# EasyEDA Pro project ESP32S3_DMX_RDM_2026-06-09.epro, schematic Schematic_BAT

## Sheets
1 P1: Create Date: 2026-08-19; Page Name: P1; Project Name: ESP32S3_DMX_RDM_2026-06-09; Schematic Name: Schematic1; Update Date: 2026-08-19; Company: 嘉立创EDA; Page Size: A3; Version: V1.0
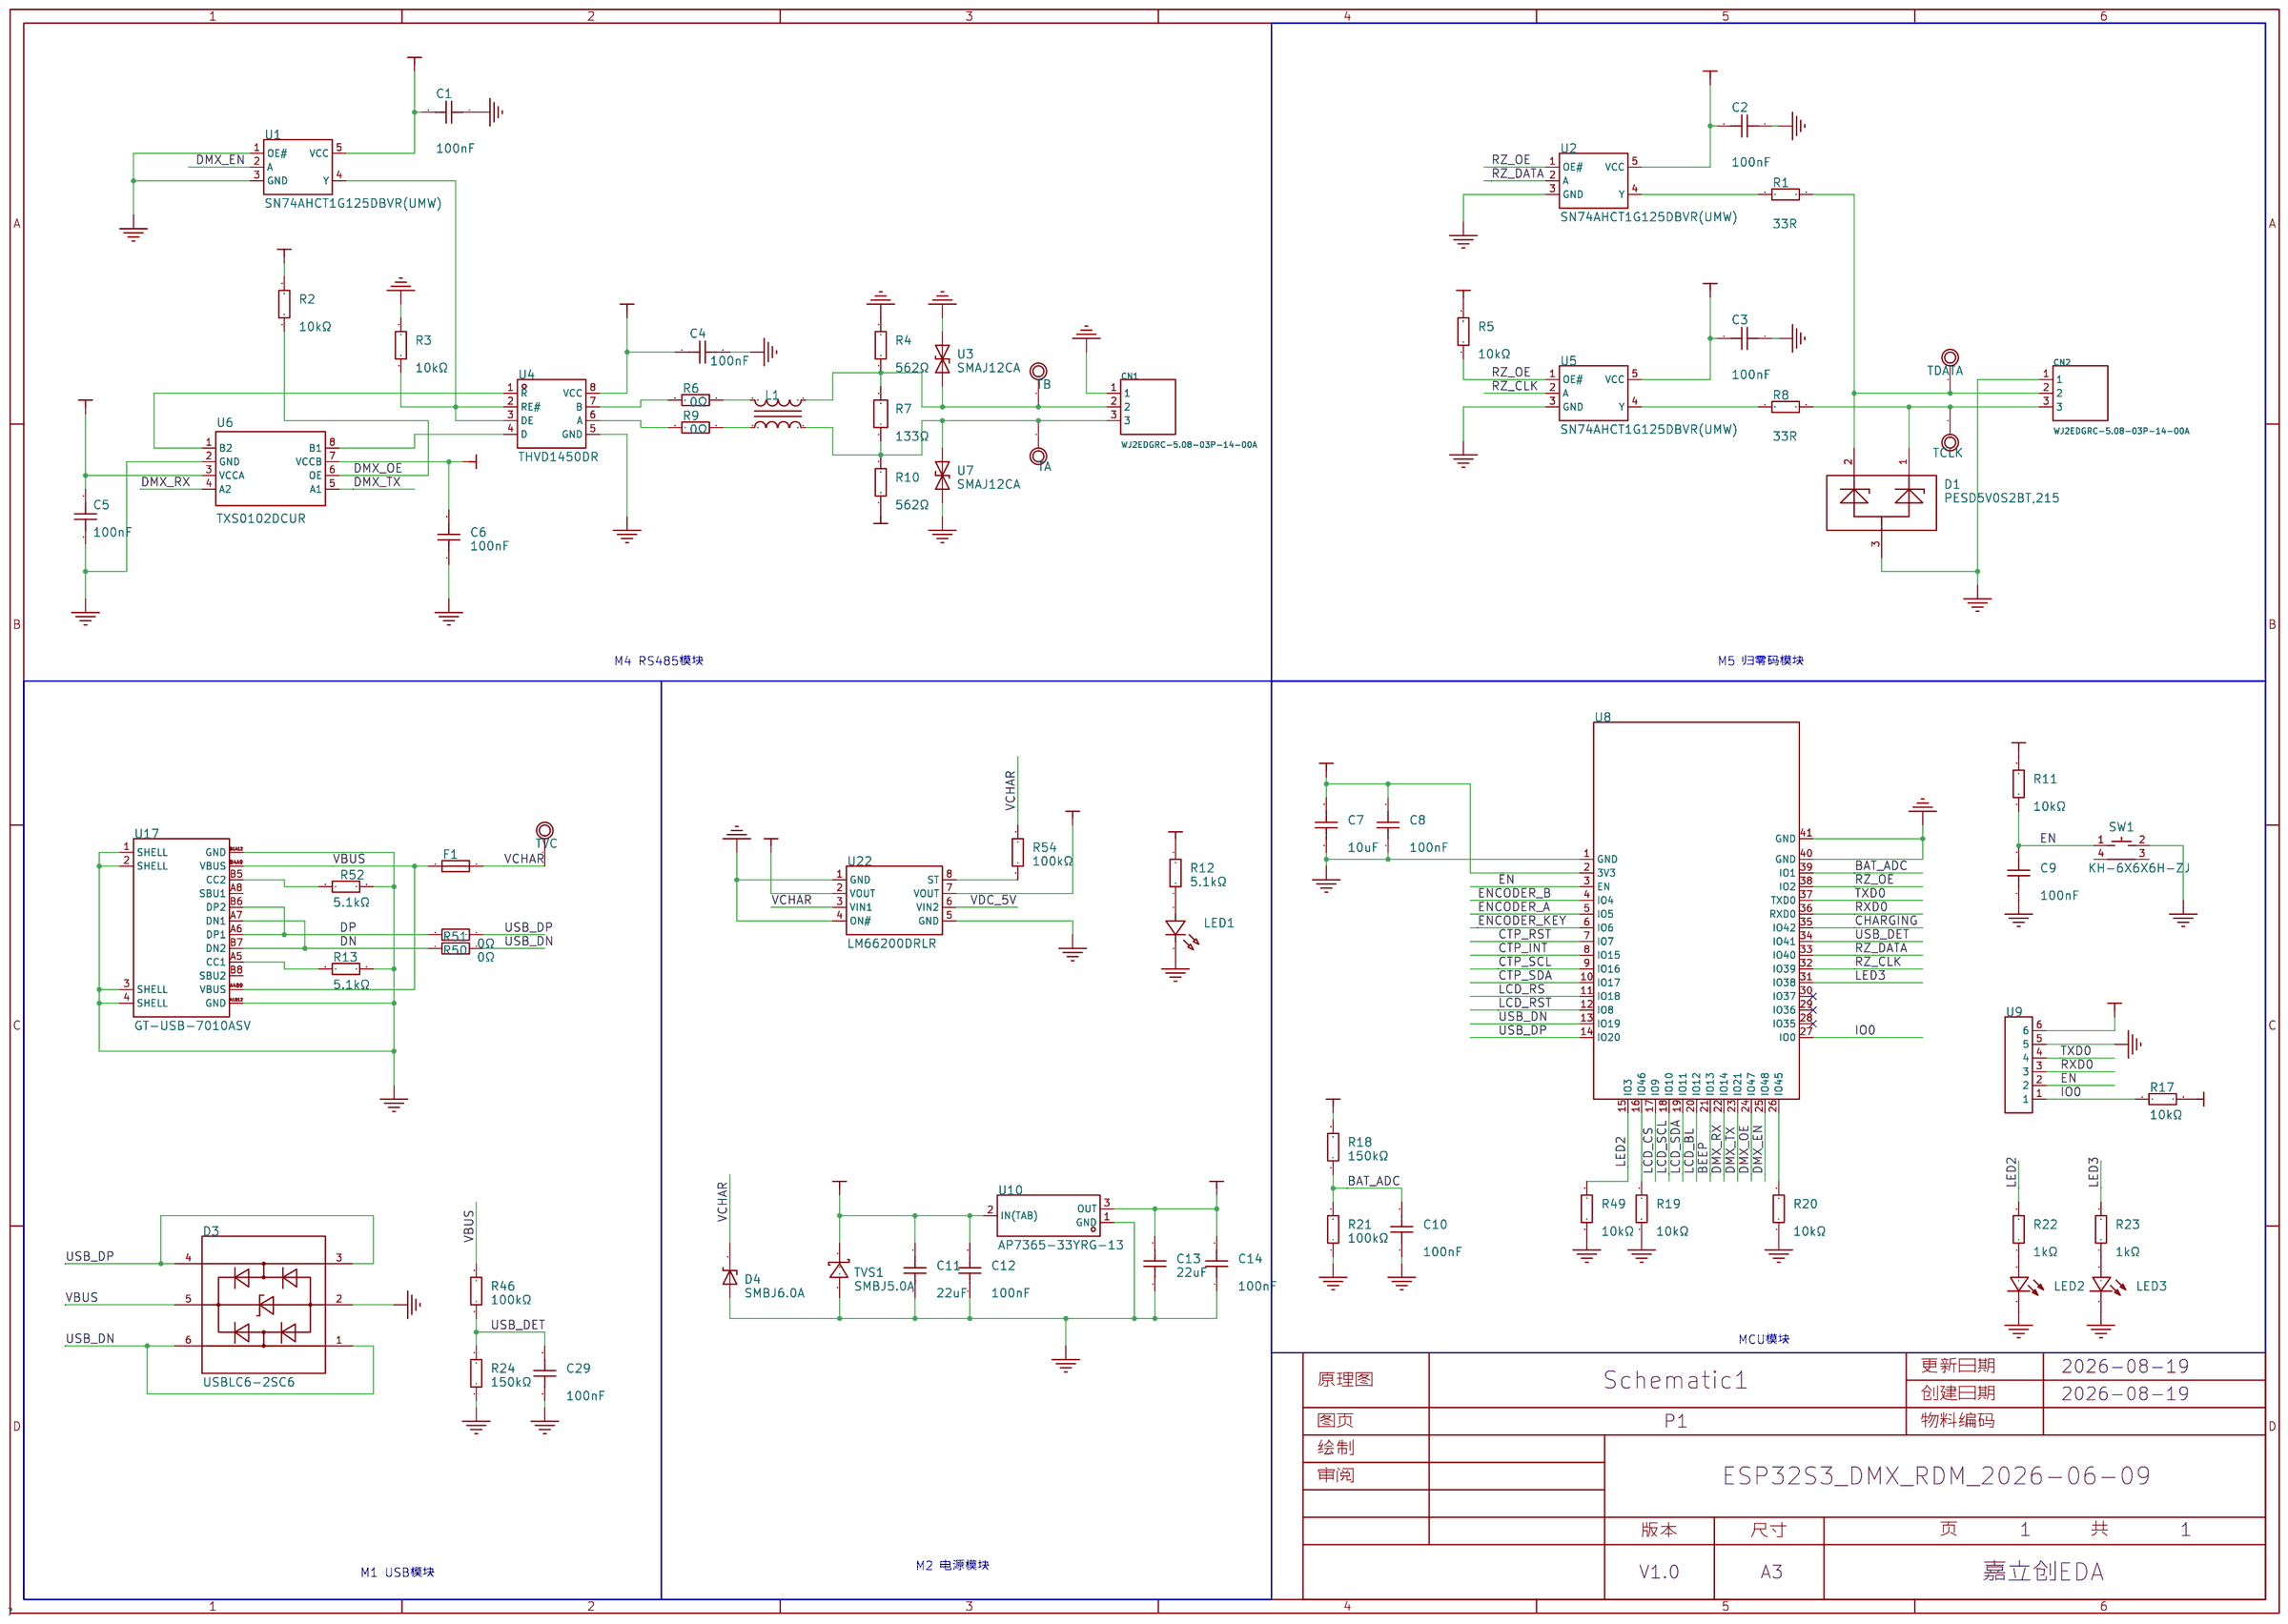
[diagram p1: P1]
2 P2: Page Name: P2; Schematic Name: Schematic_BAT
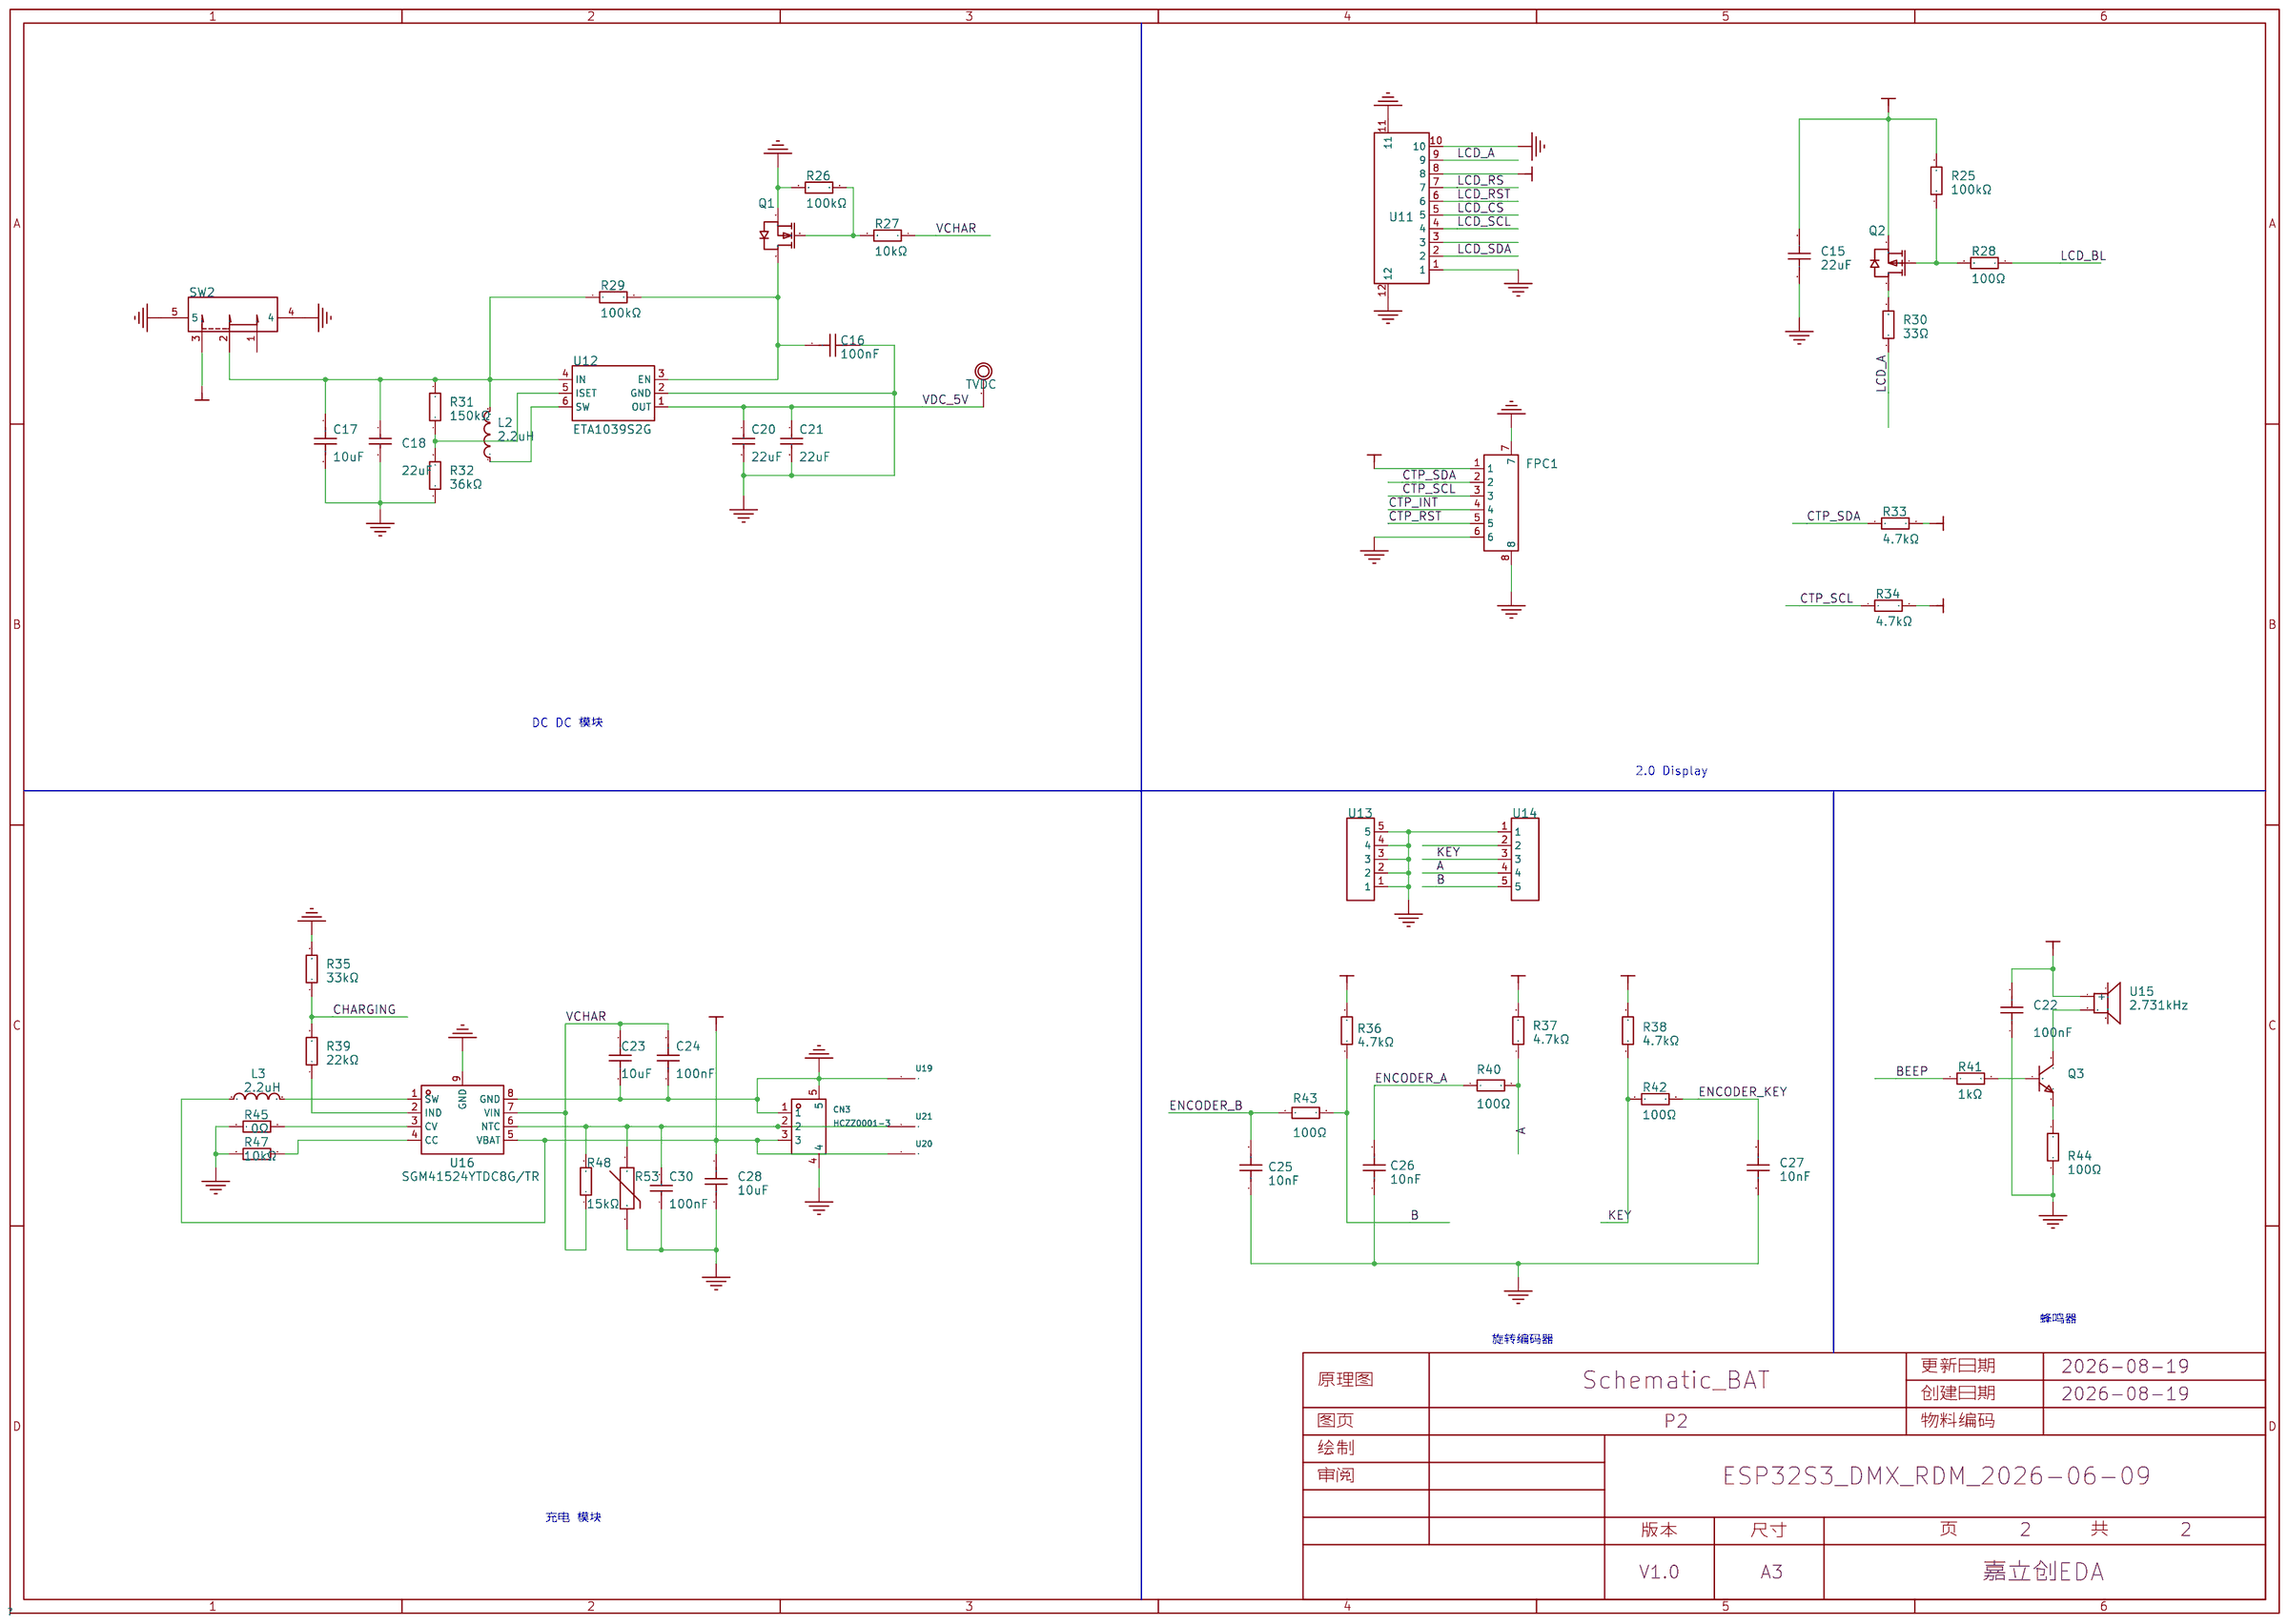
[diagram p2: P2]

## Parts
sheet P1
C1  100nF  [C0805]
C2  100nF  [C0805]
C3  100nF  [C0805]
C4  100nF  [C0805]
C5  100nF  [C0805]
C6  100nF  [C0805]
C7  10uF  [C0805]
C8  100nF  [C0805]
C9  100nF  [C0805]
C10  100nF  [C0805]
C11  22uF  [C0805]
C12  100nF  [C0805]
C13  22uF  [C0805]
C14  100nF  [C0805]
C29  100nF  [C0805]
CN1  WJ2EDGRC-5.08-03P-14-00A  [CONN-TH_3P-P5.08_WJ2EDGRC-5.08-3P]
CN2  WJ2EDGRC-5.08-03P-14-00A  [CONN-TH_3P-P5.08_WJ2EDGRC-5.08-3P]
D1  PESD5V0S2BT,215  [SOT-23_L2.9-W1.3-P1.90-LS2.4-BR]
D3  USBLC6-2SC6  [SOT-23-6_L2.9-W1.6-P0.95-LS2.8-BL]
D4  SMBJ6.0A  [SMB_L4.5-W3.7-LS5.4-RD]
F1  1206L300SL16ARG  [L1206]
L1  SMW2012B900DTE  [FILTER-SMD_4P-L2.0-W1.2-BL]
LED1  MHK1375CRBTD  [LED-TH_MHK1375CRBTD]
LED2  MHK1375CGBTD  [LED-TH_MHK1375CGBTD]
LED3  MHK1375CGBTD  [LED-TH_MHK1375CGBTD]
R1  33R  [R0805]
R2  10kΩ  [R0805]
R3  10kΩ  [R0805]
R4  562Ω  [R0805]
R5  10kΩ  [R0805]
R6  0Ω  [R0805]
R7  133Ω  [R0805]
R8  33R  [R0805]
R9  0Ω  [R0805]
R10  562Ω  [R0805]
R11  10kΩ  [R0805]
R12  5.1kΩ  [R0805]
R13  5.1kΩ  [R0805]
R17  10kΩ  [R0805]
R18  150kΩ  [R0805]
R19  10kΩ  [R0805]
R20  10kΩ  [R0805]
R21  100kΩ  [R0805_NEW]
R22  1kΩ  [R0805]
R23  1kΩ  [R0805]
R24  150kΩ  [R0805]
R46  100kΩ  [R0805]
R49  10kΩ  [R0805]
R50  0Ω  [R0805]
R51  0Ω  [R0805]
R52  5.1kΩ  [R0805]
R54  100kΩ  [R0805]
SW1  KH-6X6X6H-ZJ  [SW-TH_KH-6X6X6H-ZJ-A]
TA  -  [测试点]
TB  -  [测试点]
TCLK  -  [测试点]
TDATA  -  [测试点]
TVC  -  [测试点]
TVS1  SMBJ5.0A  [SMB_L4.6-W3.6-LS5.3-RD]
U1  SN74AHCT1G125DBVR(UMW)  [SOT-23-5_L3.0-W1.5-P0.95-LS2.8-BL]
U2  SN74AHCT1G125DBVR(UMW)  [SOT-23-5_L3.0-W1.5-P0.95-LS2.8-BL]
U3  SMAJ12CA  [SMA_L4.3-W2.7-LS5.1-BI]
U4  THVD1450DR  [SOIC-8_L4.9-W3.9-P1.27-LS6.0-BL]
U5  SN74AHCT1G125DBVR(UMW)  [SOT-23-5_L3.0-W1.5-P0.95-LS2.8-BL]
U6  TXS0102DCUR  [VSON8_L2.0-W2.3-P0.50-LS3.1-BL]
U7  SMAJ12CA  [SMA_L4.3-W2.7-LS5.1-BI]
U8  2.4GHz  [WIRELM-SMD_ESP32-S3-WROOM-1]
U9  LAIL-PZ2.54-6P-L  [CONN-TH_LAIL-PZ2.54-6P-L]
U10  AP7365-33YRG-13  [SOT-89-3_L4.5-W2.5-P1.50-LS4.2-BR]
U17  GT-USB-7010ASV  [USB-C-SMD_G-SWITCH_GT-USB-7010ASV]
U22  LM66200DRLR  [SOT-583-8_L2.1-W1.2-P0.50-LS1.6-BL]
sheet P2
C15  22uF  [C0805]
C16  100nF  [C0805]
C17  10uF  [C0805]
C18  22uF  [C0805]
C20  22uF  [C0805]
C21  22uF  [C0805]
C22  100nF  [C0805]
C23  10uF  [C0805]
C24  100nF  [C0805]
C25  10nF  [C0805]
C26  10nF  [C0805]
C27  10nF  [C0805]
C28  10uF  [C0805]
C30  100nF  [C0603]
CN3  HCZZ0001-3  [CONN-SMD_3P-P1.25_HCZZ0001-3]
FPC1  05B20L06P  [FPC-SMD_6P-P0.50_05B20L06P]
L2  2.2uH  [IND-SMD_L4.0-W4.0]
L3  2.2uH  [IND-SMD_L4.0-W4.0]
Q1  NTR4503NT1G  [SOT-23-3_L2.9-W1.3-P1.90-LS2.4-BR]
Q2  AO3401A  [SOT-23-3_L2.9-W1.3-P1.90-LS2.4-BR]
Q3  S8050  [SOT-23-3_L2.9-W1.3-P1.90-LS2.4-BR]
R25  100kΩ  [R0805]
R26  100kΩ  [R0805]
R27  10kΩ  [R0805]
R28  100Ω  [R0805]
R29  100kΩ  [R0805]
R30  33Ω  [R0805]
R31  150kΩ  [R0805]
R32  36kΩ  [R0805]
R33  4.7kΩ  [R0805]
R34  4.7kΩ  [R0805]
R35  33kΩ  [R0805]
R36  4.7kΩ  [R0805]
R37  4.7kΩ  [R0805]
R38  4.7kΩ  [R0805]
R39  22kΩ  [R0805]
R40  100Ω  [R0805]
R41  1kΩ  [R0805]
R42  100Ω  [R0805]
R43  100Ω  [R0805]
R44  100Ω  [R0805]
R45  0Ω  [R0805]
R47  10kΩ  [R0805]
R48  15kΩ  [R0805]
R53  SDNT1608X103F3950FTF  [R0603]
SW2  SK-12D02-G030  [SW-TH_SK-12D02VG3]
TVDC  -  [测试点]
U11  HC-FPC-0.5-10P-CSH20  [FPC-SMD_10P-P0.50_HC-FPC-0.5-10P-CSH20]
U12  ETA1039S2G  [SOT-23-6_L2.9-W1.6-P0.95-LS2.8-BR]
U13  2541WV-05P  [HDR-TH_5P-P2.54-V-M]
U14  2541WV-05P  [HDR-TH_5P-P2.54-V-M]
U15  2.731kHz  [BUZ-SMD_4P-L8.5-W8.5-P8.50-TL-A]
U16  SGM41524YTDC8G/TR  [DFN-8_L3.0-W2.0-P0.50-TL-EP-1]
U19  电池焊盘  [电池焊盘]
U20  电池焊盘  [电池焊盘]
U21  电池焊盘  [电池焊盘]

## Library data of the parts
C1-C6 C8-C10 C12 C14 C16 C22 C24 C29 = CC0805KRX7R9BB104: 容值:100nF;精度:±10%;额定电压:50V;温度系数:X7R;; LCSC Part Name: 100nF ±10% 50V; Supplier Part: C49678; Manufacturer: YAGEO(国巨); Supplier Footprint: 0805; JLCPCB Part Class: Basic Part; Datasheet: https://item.szlcsc.com/datasheet/CC0805KRX7R9BB104/50686.html; Supplier: LCSC; Tolerance: ±10%; Voltage Rating: 50V; Temperature Coefficient: X7R
C7 = GRM21BR61C106KE15K: 容值:10uF;精度:±10%;额定电压:16V;温度系数:X5R;; LCSC Part Name: 10uF ±10% 16V; Supplier Part: GRM21BR61C106KE15K.1; Manufacturer: muRata(村田); Supplier Footprint: 0805; JLCPCB Part Class: Extended Part; Datasheet: https://item.szlcsc.com/datasheet/GRM21BR61C106KE15K/397163.html; Supplier: LCSC; Tolerance: ±10%; Voltage Rating: 16V; Temperature Coefficient: X5R
C11 C13 C15 = GRM21BR61A226ME51K: 容值:22uF;精度:±20%;额定电压:10V;温度系数:X5R;; LCSC Part Name: 22uF ±20% 10V; Supplier Part: GRM21BR61A226ME51K.1; Manufacturer: muRata(村田); Supplier Footprint: 0805; JLCPCB Part Class: Extended Part; Datasheet: https://item.szlcsc.com/datasheet/GRM21BR61A226ME51K/2269894.html; Supplier: LCSC; Tolerance: ±20%; Voltage Rating: 10V; Temperature Coefficient: X5R
CN1 CN2 = WJ2EDGRC-5.08-03P-14-00A: 连接器类型:板端/插座-闭口;固定方式:卡扣固定;结构:1x3P;间距:5.08mm;颜色:绿色;安装方式:弯插;排数:1;每排PIN数:3;额定电流:10A;额定电压:300V;线规 - AWG:-;线规 - 平方毫米:-;工作温度:-40℃~+105℃;; LCSC Part Name: 卡扣固定 1x3P 5.08mm 排数:1 每排P数:3; Supplier Part: C8377; Manufacturer: KANGNEX(康奈克斯电气); Supplier Footprint: 弯插,P=5.08mm; JLCPCB Part Class: Extended Part; Datasheet: https://item.szlcsc.com/datasheet/WJ2EDGRC-5.08-03P-14-00A/8871.html; Supplier: LCSC; Connector Type: 板端/插座-闭口; Termination Style: 卡扣固定; Number of Positions or Pins: 1x3P; Pitch: 5.08mm; Color: 绿色; Mounting Type: 弯插; Number of Pins: 3P; Number of Rows: 1; Number of PINs Per Row: 3; Current Rating: 10A; Voltage Rating (Max): 300V; Operating Temperature: -40℃~+105℃
D1 = PESD5V0S2BT,215: 极性:双向;反向截止电压(Vrwm):5V;钳位电压:14V;峰值脉冲电流(Ipp):12A;峰值脉冲功率(Ppp):130W@8/20us;击穿电压:5.5V;; LCSC Part Name: 双向ESD; Supplier Part: C49338; Manufacturer: Nexperia(安世); Supplier Footprint: SOT-23; JLCPCB Part Class: Extended Part; Datasheet: https://item.szlcsc.com/datasheet/PESD5V0S2BT%252C215/50346.html; Supplier: LCSC; Polarity: 双向; Reverse Stand-Off Voltage (Vrwm): 5V; Clamping Voltage: 14V; Peak Pulse Current (Ipp): 12A; Peak Pulse Power Dissipation (Ppp): 130W@8/20us; Voltage - Breakdown: 5.5V; Reverse Leakage Current (Ir): 5nA; Number of Channels: 双路; level of protection: IEC 61000-4-5；IEC 61000-4-2; Type: ESD; Junction Capacitance: 35pF
D3 = USBLC6-2SC6_C7519: 极性:单向;反向截止电压(Vrwm):5.25V;钳位电压:17V;峰值脉冲电流(Ipp):5A;击穿电压:6V;; LCSC Part Name: 单向ESD; Supplier Part: USBLC6-2SC6.1; Manufacturer: ST(意法半导体); Supplier Footprint: SOT-23-6L; JLCPCB Part Class: Extended Part; Datasheet: https://item.szlcsc.com/datasheet/USBLC6-2SC6/7996.html; Supplier: LCSC; Polarity: 单向; Reverse Stand-Off Voltage (Vrwm): 5.25V; Clamping Voltage: 17V; Peak Pulse Current (Ipp): 5A; Voltage - Breakdown: 6V; Reverse Leakage Current (Ir): 150nA; Number of Channels: 双路; Operating Temperature: -40℃~+125℃; level of protection: IEC 61000-4-2; Type: ESD; Junction Capacitance: 3.5pF
D4 = SMBJ6.0A_C3001967: 极性:单向;反向截止电压(Vrwm):6V;钳位电压:10.3V;峰值脉冲电流(Ipp):58.3A;峰值脉冲功率(Ppp):600W@10/1000us;击穿电压(VBR):6.67V;; LCSC Part Name: 双向TVS 6V截止 峰值浪涌电流：58.3A; Supplier Part: C3001967; Manufacturer: UMW(友台半导体); Supplier Footprint: SMB(DO-214AA); JLCPCB Part Class: Extended Part; Datasheet: https://item.szlcsc.com/datasheet/SMBJ6.0A/3486674.html; Supplier: LCSC; Polarity: 单向; Reverse Stand-Off Voltage (Vrwm): 6V; Clamping Voltage: 10.3V; Peak Pulse Current (Ipp): 58.3A; Peak Pulse Power Dissipation (Ppp): 600W@10/1000us; Voltage - Breakdown: 6.67V; Reverse Leakage Current (Ir): 800uA; Number of Channels: 单路; Operating Temperature: -55℃~+150℃; level of protection: IEC 61000-4-4；IEC 61000-4-2; Type: TVS
F1 = 1206L300SL16ARG: 耐压(Vmax):16V;最大电流(Imax):50A;保持电流(Ihold):3A;跳闸电流(Itrip):6A;; LCSC Part Name: 16V 3.00A 1206 低电阻自恢复自恢复; Supplier Part: C28326707; Manufacturer: LUTE(陆特); Supplier Footprint: 1206; JLCPCB Part Class: Extended Part; Datasheet: https://item.szlcsc.com/datasheet/1206L300SL16ARG/30063183.html; Supplier: LCSC; Voltage - Max: 16V; Current - Max: 50A; Hold Current: 3A; Trip Current: 6A; Power Dissipation: 1.2W; Resistance - Initial (Ri) (Min): 3mΩ; Resistance - Post Trip (R1) (Max): 30mΩ; Time to Trip(Max): 5s; Operating Temperature: -40℃~+85℃; Length: 3.5mm; Width: 1.85mm; Height: 1.2mm
L1 = SMW2012B900DTE: 通道数:2;阻抗@频率:90Ω@100MHz;直流电阻(DCR):300mΩ;; LCSC Part Name: 两路 0805共模滤波器 阻抗90Ω@100MHz; Supplier Part: C206236; Manufacturer: Sunltech(顺磁); Supplier Footprint: SMD-4P,2x1.2mm; JLCPCB Part Class: Extended Part; Datasheet: https://item.szlcsc.com/datasheet/SMW2012B900DTE/207281.html; Supplier: LCSC; Number of Lines: 2; Voltage Withstand: 125V; Current Rating: 400mA; Voltage Rating - DC: 50V; Impedance @ Frequency: 90Ω@100MHz; DC Resistance(DCR): 300mΩ; Operating Temperature: -25℃~+85℃
LED1 = MHK1375CRBTD: 灯头类型:-;发光颜色:红色;正向压降(Vf):2.05V;功率:75mW;正向电流:20mA;波长:628nm;二极管配置:-;透镜颜色:雾状红透镜;色温:-;发光角度:60°;载带方式:-;工作温度:-25℃~+85℃;; LCSC Part Name: 红灯; Supplier Part: C2764901; Manufacturer: MEIHUA(美华); Supplier Footprint: 插件,P=2.54mm; JLCPCB Part Class: 扩展库; Datasheet: https://item.szlcsc.com/datasheet/MHK1375CRBTD/2899589.html; Supplier: LCSC; Illumination Color: 红色; Voltage - Forward(Vf): 2.05V; Power(Watts): 75mW; Forward Current: 20mA; Wavelength - Dominant: 628nm; Lens Color: 雾状红透镜; Viewing Angle: 60°; Operating Temperature: -25℃~+85℃
LED2 LED3 = MHK1375CGBTD: 灯头类型:组装式圆形灯头;发光颜色:黄绿色;功率:78mW;正向电流:20mA;主波长:568nm;二极管配置:-;透镜颜色:雾状绿透镜;色温:-;发光角度:80°;载带方式:-;工作温度:-25℃~+85℃;; LCSC Part Name: 普绿/黄绿; Supplier Part: C409769; Manufacturer: MEIHUA(美华); Supplier Footprint: 插件,P=2.54mm; JLCPCB Part Class: 扩展库; Datasheet: https://atta.szlcsc.com/upload/public/pdf/source/20190807/C409769_BD2FEBD402124B53381C1A24DEF8BEC4.pdf; Supplier: LCSC; Lamp Holder Type: 组装式圆形灯头; Emitted Color: 黄绿色; Power Dissipation: 78mW; Forward Current: 20mA; Dominant Wavelength: 568nm; Lens Color: 雾状绿透镜; Viewing Angle: 80°; Operating Temperature: -25℃~+85℃
R1 R8 = RC0805FR-0733RL: 电阻类型:厚膜电阻;阻值:33Ω;精度:±1%;功率:125mW;工作电压:150V;温度系数:±100ppm/℃;; LCSC Part Name: 厚膜电阻 33Ω ±1% 125mW; Supplier Part: RC0805FR-0733RL.1; Manufacturer: YAGEO(国巨); Supplier Footprint: 0805; JLCPCB Part Class: Extended Part; Datasheet: https://item.szlcsc.com/datasheet/RC0805FR-0733RL/137633.html; Supplier: LCSC; Type: 厚膜电阻; Tolerance: ±1%; Power(Watts): 125mW; Voltage-Supply(Max): 150V; Temperature Coefficient: ±100ppm/℃; Operating Temperature: -55℃~+155℃
R2 R3 R5 R11 R17 R19 R20 R27 R49 = RC0805JR-0710KL: 电阻类型:厚膜电阻;阻值:10kΩ;精度:±5%;功率:125mW;最大工作电压:150V;温度系数:±100ppm/℃;; LCSC Part Name: 厚膜电阻 10kΩ ±5% 125mW; Supplier Part: C100047; Manufacturer: YAGEO(国巨); Supplier Footprint: 0805; JLCPCB Part Class: Extended Part; Datasheet: https://atta.szlcsc.com/upload/public/pdf/source/20170708/1499509500945.pdf; Supplier: LCSC; Type: 厚膜电阻; Tolerance: ±5%; Power(Watts): 125mW; Overload Voltage (Max): 150V; Temperature Coefficient: ±100ppm/℃; Operating Temperature Range: -55℃~+155℃
R4 R10 = AC0805FR-07562RL: 电阻类型:厚膜电阻;阻值:562Ω;精度:±1%;功率:125mW;工作电压:150V;温度系数:±100ppm/℃;; LCSC Part Name: 厚膜电阻 562Ω ±1% 125mW; Supplier Part: C228905; Manufacturer: YAGEO(国巨); Supplier Footprint: 0805; JLCPCB Part Class: Extended Part; Datasheet: https://item.szlcsc.com/datasheet/AC0805FR-07562RL/228935.html; Supplier: LCSC; Type: 厚膜电阻; Tolerance: ±1%; Power(Watts): 125mW; Voltage-Supply(Max): 150V; Temperature Coefficient: ±100ppm/℃; Operating Temperature: -55℃~+155℃
R6 R9 R45 R50 R51 = RC0805FR-070RL: 电阻类型:厚膜电阻;阻值:0Ω;精度:±1%;功率:125mW;工作电压:150V;温度系数:-;; LCSC Part Name: 厚膜电阻 0Ω ±1% 125mW; Supplier Part: C100045; Manufacturer: YAGEO(国巨); Supplier Footprint: 0805; JLCPCB Part Class: Extended Part; Datasheet: https://item.szlcsc.com/datasheet/RC0805FR-070RL/101259.html; Supplier: LCSC; Type: 厚膜电阻; Tolerance: ±1%; Power(Watts): 125mW; Voltage-Supply(Max): 150V; Operating Temperature: -55℃~+155℃
R7 = RC0805FR-07133RL: 电阻类型:厚膜电阻;阻值:133Ω;精度:±1%;功率:125mW;工作电压:150V;温度系数:±100ppm/℃;; LCSC Part Name: 厚膜电阻 133Ω ±1% 125mW; Supplier Part: C483009; Manufacturer: YAGEO(国巨); Supplier Footprint: 0805; JLCPCB Part Class: Extended Part; Datasheet: https://item.szlcsc.com/datasheet/RC0805FR-07133RL/490870.html; Supplier: LCSC; Type: 厚膜电阻; Tolerance: ±1%; Power(Watts): 125mW; Voltage-Supply(Max): 150V; Temperature Coefficient: ±100ppm/℃; Operating Temperature: -55℃~+155℃
R12 R13 R52 = RC0805FR-075K1L: 电阻类型:厚膜电阻;阻值:5.1kΩ;精度:±1%;功率:125mW;工作电压:150V;温度系数:±100ppm/℃;; LCSC Part Name: 厚膜电阻 5.1kΩ ±1% 125mW; Supplier Part: C84375; Manufacturer: YAGEO(国巨); Supplier Footprint: 0805; JLCPCB Part Class: Extended Part; Datasheet: https://item.szlcsc.com/datasheet/RC0805FR-075K1L/85545.html; Supplier: LCSC; Type: 厚膜电阻; Tolerance: ±1%; Power(Watts): 125mW; Voltage-Supply(Max): 150V; Temperature Coefficient: ±100ppm/℃; Operating Temperature: -55℃~+155℃
R18 R24 R31 = RC0805FR-07150KL: 电阻类型:厚膜电阻;阻值:150kΩ;精度:±1%;功率:125mW;工作电压:150V;温度系数:±100ppm/℃;; LCSC Part Name: 厚膜电阻 150kΩ ±1% 125mW; Supplier Part: C114558; Manufacturer: YAGEO(国巨); Supplier Footprint: 0805; JLCPCB Part Class: Extended Part; Datasheet: https://item.szlcsc.com/datasheet/RC0805FR-07150KL/115802.html; Supplier: LCSC; Type: 厚膜电阻; Tolerance: ±1%; Power(Watts): 125mW; Voltage-Supply(Max): 150V; Temperature Coefficient: ±100ppm/℃; Operating Temperature: -55℃~+155℃
R21 = RC0805FR-07100KL: 电阻类型:厚膜电阻;阻值:100kΩ;精度:±1%;功率:125mW;工作电压:150V;温度系数:±100ppm/℃;; LCSC Part Name: 厚膜电阻 100kΩ ±1% 125mW; Supplier Part: C96346; Manufacturer: YAGEO(国巨); Supplier Footprint: 0805; JLCPCB Part Class: Extended Part; Datasheet: https://item.szlcsc.com/datasheet/RC0805FR-07100KL/97550.html; Supplier: LCSC; Type: 厚膜电阻; Tolerance: ±1%; Power(Watts): 125mW; Voltage-Supply(Max): 150V; Temperature Coefficient: ±100ppm/℃; Operating Temperature: -55℃~+155℃
R22 R23 R41 = RC0805JR-071KL: 电阻类型:厚膜电阻;阻值:1kΩ;精度:±5%;功率:125mW;最大工作电压:150V;温度系数:±100ppm/℃;; LCSC Part Name: 厚膜电阻 1kΩ ±5% 125mW; Supplier Part: C100046; Manufacturer: YAGEO(国巨); Supplier Footprint: 0805; JLCPCB Part Class: Extended Part; Datasheet: https://atta.szlcsc.com/upload/public/pdf/source/20170708/1499509500945.pdf; Supplier: LCSC; Type: 厚膜电阻; Tolerance: ±5%; Power(Watts): 125mW; Overload Voltage (Max): 150V; Temperature Coefficient: ±100ppm/℃; Operating Temperature Range: -55℃~+155℃
R25 R26 R29 R46 R54 = RC0805JR-07100KL: 电阻类型:厚膜电阻;阻值:100kΩ;精度:±5%;功率:125mW;工作电压:150V;温度系数:±100ppm/℃;; LCSC Part Name: 厚膜电阻 100kΩ ±5% 125mW; Supplier Part: C100049; Manufacturer: YAGEO(国巨); Supplier Footprint: 0805; JLCPCB Part Class: Extended Part; Datasheet: https://item.szlcsc.com/datasheet/RC0805JR-07100KL/101263.html; Supplier: LCSC; Type: 厚膜电阻; Tolerance: ±5%; Power(Watts): 125mW; Voltage-Supply(Max): 150V; Temperature Coefficient: ±100ppm/℃; Operating Temperature: -55℃~+155℃
SW1 = KH-6X6X6H-ZJ: 电路结构:单刀单掷;按钮形状:圆形按钮;作用力:-;安装方式:弯插;开关长度:7.5mm;开关宽度:6mm;开关高度:11.5mm;带支架:带支架;触点电流:-;额定电压:-;带灯:无;工作寿命:10万次;; LCSC Part Name: 7.5mm 6mm 11.5mm; Supplier Part: C2837542; Manufacturer: kinghelm(金航标); Supplier Footprint: 插件; JLCPCB Part Class: Extended Part; Datasheet: https://item.szlcsc.com/datasheet/KH-6X6X6H-ZJ/3009612.html; Supplier: LCSC; Circuit: 单刀单掷; Actuator Style: 圆形按钮; Mounting Type: 弯插; Length: 7.5mm; Width: 6mm; Switch Height: 11.5mm; with Bracket: 带支架; Actuator/Cap Color: 黑色; With Lamp: 无; Termination Style: PC引脚; Life: 10万次
TA TB TCLK TDATA TVC TVDC = 测试点
TVS1 = SMBJ5.0A: 极性:单向;反向截止电压(Vrwm):5V;钳位电压:9.2V;峰值脉冲电流(Ipp):65.22A;峰值脉冲功率(Ppp):600W@10/1000us;击穿电压:6.4V;; LCSC Part Name: 单向TVS 5V截止 峰值浪涌电流：65.22A; Supplier Part: SMBJ5.0A_C357965.1; Manufacturer: DOWO(东沃); Supplier Footprint: SMB(DO-214AA); JLCPCB Part Class: Extended Part; Datasheet: https://item.szlcsc.com/datasheet/SMBJ5.0A/333049.html; Supplier: LCSC; Polarity: 单向; Reverse Stand-Off Voltage (Vrwm): 5V; Clamping Voltage: 9.2V; Peak Pulse Current (Ipp): 65.22A; Peak Pulse Power Dissipation (Ppp): 600W@10/1000us; Voltage - Breakdown: 6.4V; Reverse Leakage Current (Ir): 800uA; Type: TVS
U1 U2 U5 = SN74AHCT1G125DBVR(UMW): 逻辑类型:-;通道数:1;工作电压:4.5V~5.5V;静态电流(Iq):10uA;传播延迟(tpd):12ns@5V,50pF;; LCSC Part Name: 三态输出，单路总线缓冲门; Supplier Part: C20617903; Manufacturer: UMW(友台半导体); Supplier Footprint: SOT-23-5; JLCPCB Part Class: Extended Part; Datasheet: https://item.szlcsc.com/datasheet/SN74AHCT1G125DBVR(UMW)/21992700.html; Supplier: LCSC; Number of Channels: 1; Voltage - Supply: 4.5V~5.5V; Quiescent Current: 10uA; Current - Output Low(IOL): 8mA; Current - Output High(IOH): 8mA; Input Logic Level - High: 2V; Input Logic Level - Low: 800mV; Output Logic Level - High: 4.4V；3.8V; Output Logic Level - Low: 440mV; Series: 74AHCT; Propagation Delay: 12ns@5V,50pF; Operating Temperature: -40℃~+125℃; Input Number: 1; Features: 可控输出使能
U3 U7 = SMAJ12CA_C3001959: 极性:双向;反向截止电压(Vrwm):12V;钳位电压:19.9V;峰值脉冲电流(Ipp):20.1A;峰值脉冲功率(Ppp):400W;击穿电压:13.3V;; LCSC Part Name: 双向TVS 12V截止 峰值脉冲电流：20.1A; Supplier Part: C3001959; Manufacturer: UMW(友台半导体); Supplier Footprint: DO-214AC(SMA); JLCPCB Part Class: Extended Part; Datasheet: https://item.szlcsc.com/datasheet/SMAJ12CA/3486666.html; Supplier: LCSC; Polarity: 双向; Reverse Stand-Off Voltage (Vrwm): 12V; Clamping Voltage: 19.9V; Peak Pulse Current (Ipp): 20.1A; Peak Pulse Power Dissipation (Ppp): 400W; Voltage - Breakdown: 13.3V; Reverse Leakage Current (Ir): 1uA; Type: TVS
U4 = THVD1450DR: 类型:收发器;数据速率:50Mbps;; LCSC Part Name: 3V至5.5V单电源供电RS-485/RS-422收发器; Supplier Part: THVD1450DR.1; Manufacturer: TI(德州仪器); Supplier Footprint: SOIC-8; JLCPCB Part Class: Extended Part; Datasheet: https://www.ti.com/cn/lit/gpn/thvd1452; Supplier: LCSC; Type: 收发器; Number of Drivers: 1; Number of Receivers: 1; Voltage - Supply: 3V~5.5V; Data Rate: 50Mbps; Number of Nodes: 256; ESD Protect: ±18kV; Operating Temperature: -40℃~+125℃; Quiescent Supply Current: 3mA; Communication Mode: 半双工
U6 = TXS0102DCUR: 数据速率:24Mbps;工作电压(VCCA):1.65V~3.6V;工作电压(VCCB):2.3V~5.5V;元件数:1;每个电路通道数:2;; LCSC Part Name: 24Mbps 2位双向电平转换器; Supplier Part: TXS0102DCUR.1; Manufacturer: TI(德州仪器); Supplier Footprint: VSSOP-8; JLCPCB Part Class: Extended Part; Datasheet: https://www.ti.com/lit/ds/symlink/txs0102.pdf?ts=1761116535177; Supplier: LCSC; Channel Type: 双向; Data Rate: 24Mbps; Voltage - Supply(VCCA): 1.65V~3.6V; Voltage - Supply(VCCB): 2.3V~5.5V; Number of Elements: 1; Number of Circuits: 2; Output Type: 开漏；推挽式; Operating Temperature: -40℃~+85℃; Features: 自动方向检测
U8 = ESP32-S3-WROOM-1-N16R8: 核心芯片:ESP32-S3R8;频率:2.4GHz;天线形式:板载PCB天线;发射功率:20.5dBm;接收灵敏度:-103.5dBm;; LCSC Part Name: 不带固件 通用型Wi-Fi+低功耗蓝牙MCU模组; Supplier Part: ESP32-S3-WROOM-1(N16R8).1; Manufacturer: ESPRESSIF(乐鑫); Supplier Footprint: SMD,25.5x18mm; JLCPCB Part Class: Extended Part; Datasheet: https://item.szlcsc.com/datasheet/ESP32-S3-WROOM-1-N16R8/3198300.html; Supplier: LCSC; Utilized IC / Part: ESP32-S3R8; Interface Type: I2C；GPIO；UART；SPI；USB；I2S; Antenna Type: 板载PCB天线; Output Power: 20.5dBm; Voltage - Supply: 3V~3.6V; Receive  Current: 95mA; Send  Current: 355mA; Sensitivity: -103.5dBm; Operating Temperature: -40℃~+65℃
U9 = LAIL-PZ2.54-6P-L: 插针结构:1x6P;间距:2.54mm;圆针/方针:方针;排数:单排;总PIN位数:6P;额定电流:3A;额定电压:250V;塑高:2.5mm;端接针长度:3mm;触头材质:黄铜;触头镀层:金;工作温度:-25℃~+80℃;颜色:黑色;; LCSC Part Name: 1x6P 间距:2.54mm 方针; Supplier Part: C54950607; Manufacturer: LAILAN(莱联); Supplier Footprint: 插件,P=2.54mm; JLCPCB Part Class: Extended Part; Datasheet: https://item.szlcsc.com/datasheet/LAIL-PZ2.54-6P-L/58519960.html; Supplier: LCSC; Pin Structure: 1x6P; Pitch: 2.54mm; Circluar Pins/Square Pins: 方针; Number of Rows: 单排; Number of Pins: 6P; Current Rating: 3A; Voltage Rating (Max): 250V; Insulation Height: 2.5mm; Length of End Connection Pin: 3mm; Contact Material: 黄铜; Contact Plating: 金; Operating Temperature: -25℃~+80℃; Color: 黑色
U10 = AP7365-33YRG-13: 输出极性:正极;工作电压:6V;输出电压:3.3V;输出电流:600mA;电源纹波抑制比(PSRR):65dB@(1kHz);输出类型:固定;; LCSC Part Name: 3.3V 600mA 6V; Supplier Part: AP7365-33YRG-13.1; Manufacturer: DIODES(美台); Supplier Footprint: SOT-89; JLCPCB Part Class: Extended Part; Datasheet: https://item.szlcsc.com/datasheet/AP7365-33YRG-13/464835.html; Supplier: LCSC; Output Configuration: 正极; Voltage - Supply: 6V; Output Voltage: 3.3V; Output Current: 600mA; Power Supply Rejection Ratio (PSRR): 65dB@(1kHz); Voltage Dropout: 600mV@(600mA); standby current: 35uA; Features: 过流保护；使能控制；短路保护；热关断; Operating Temperature: -40℃~+85℃@(Ta); Output Type: 固定; Number of Outputs: 1
U17 = GT-USB-7010ASV: 连接器类型:Type-C;协议标准:USB 2.0;公母:母;安装方式:卧贴;触点数量:16P;端口数量:1;额定电流 - 电源:3A;工作温度:-40℃~+85℃;; LCSC Part Name: Type-C 母 卧贴; Supplier Part: C2988369; Manufacturer: G-Switch(品赞); Supplier Footprint: SMD; JLCPCB Part Class: Extended Part; Datasheet: https://item.szlcsc.com/datasheet/GT-USB-7010ASV/3445595.html; Supplier: LCSC; Connector Type: Type-C; Protocol Standard: USB 2.0; Gender: 母; Mounting Type: 卧贴; Number of Contacts: 16P; Number of Ports: 1; Current Rating-Power: 3A; Voltage Rating: 24V; Connect-Disconnect Life: 1万次; Center Height: 1.68mm; Length: 7.35mm; Detection color: 黑色; Operating Temperature: -40℃~+85℃
U22 = LM66200DRLR: LM66200 1.6V 至 5.5V、40mΩ、2.5A、低 IQ、双输入理想二极管; LCSC Part Name: 1.6V至5V、2.5A双理想二极管，具有自动切换功能; Supplier Part: C3235556; Manufacturer: TI(德州仪器); Supplier Footprint: SOT-583; JLCPCB Part Class: Extended Part; Datasheet: https://www.ti.com/cn/lit/ds/symlink/lm66200.pdf; Supplier: LCSC; Input Voltage (Vin): 1.6V~5.5V; Number of Channels: 2; RDS(on): 74mΩ; Quiescent Current: 1.32uA; Operating Temperature: -40℃~+125℃; Features: 过温保护；带使能；反向电流阻断
C17 C23 C28 = GRM21BR61H106KE43L: 容值:10uF;精度:±10%;额定电压:50V;温度系数:X5R;; LCSC Part Name: 10uF ±10% 50V; Supplier Part: C440198; Manufacturer: muRata(村田); Supplier Footprint: 0805; JLCPCB Part Class: Basic Part; Datasheet: https://item.szlcsc.com/datasheet/GRM21BR61H106KE43L/439567.html; Supplier: LCSC; Tolerance: ±10%; Voltage Rating: 50V; Temperature Coefficient: X5R
C18 C20 C21 = GRM21BR61E226ME44L: 容值:22uF;精度:±20%;额定电压:25V;温度系数:X5R;; LCSC Part Name: 22uF ±20% 25V; Supplier Part: C86816; Manufacturer: muRata(村田); Supplier Footprint: 0805; JLCPCB Part Class: Extended Part; Datasheet: https://item.szlcsc.com/datasheet/GRM21BR61E226ME44L/87993.html; Supplier: LCSC; Tolerance: ±20%; Voltage Rating: 25V; Temperature Coefficient: X5R
C25-C27 = CC0805MRX7R9BB103: 容值:10nF;精度:±20%;额定电压:50V;温度系数:X7R;; LCSC Part Name: 10nF ±20% 50V; Supplier Part: C2169410; Manufacturer: YAGEO(国巨); Supplier Footprint: 0805; JLCPCB Part Class: Extended Part; Datasheet: https://item.szlcsc.com/datasheet/CC0805MRX7R9BB103/2261475.html; Supplier: LCSC; Tolerance: ±20%; Voltage Rating: 50V; Temperature Coefficient: X7R
C30 = CL10B104KO8NNNC: 容值:100nF;精度:±10%;额定电压:16V;温度系数:X7R;; LCSC Part Name: 100nF ±10% 16V; Supplier Part: C66501; Manufacturer: SAMSUNG(三星); Supplier Footprint: 0603; JLCPCB Part Class: Extended Part; Datasheet: https://item.szlcsc.com/datasheet/CL10B104KO8NNNC/67585.html; Supplier: LCSC; Tolerance: ±10%; Voltage Rating: 16V; Temperature Coefficient: X7R
CN3 = HCZZ0001-3: 插针结构:1x3P;间距:1.25mm;安装方式:卧贴;参考系列:PicoBlade(MX 1.25);总PIN数:3P;排数:1;每排PIN数:3;行距:-;额定电流:1A;触头材质:铜;触头镀层:锡;工作温度:-25℃~+70℃;; LCSC Part Name: 米色 1x3P 间距:1.25mm 卧贴 系列:PicoBlade(MX 1.25); Supplier Part: C7433454; Manufacturer: HC(虹成电子); Supplier Footprint: SMD,P=1.25mm,卧贴; JLCPCB Part Class: Extended Part; Datasheet: https://item.szlcsc.com/datasheet/HCZZ0001-3/8442479.html; Supplier: LCSC; Pins Structure: 1x3P; Pitch: 1.25mm; Mounting Type: 卧贴; Reference Series: PicoBlade(MX 1.25); Number of Pins: 3P; Number of Rows: 1; Number of PINs Per Row: 3; Current Rating: 1A; Contact Material: 铜; Contact Plating: 锡; Operating Temperature: -25℃~+70℃; Voltage Rating: 125V; Plastic Material: LCP; Color: 米色; Z-Height of the Board: 3.6mm; X-Length of Bottom Edge on Board (Spacing Line): 8.85mm; Y-Width of Bottom Edge on Board: 5.4mm
FPC1 = 05B20L06P: 锁定特性:抽屉式;触点类型:下接;触点数量:6P;间距:0.5mm;; LCSC Part Name: 抽屉式 下接 P数:6P 间距:0.5mm; Supplier Part: C22435651; Manufacturer: HanElectricity(瀚源); Supplier Footprint: SMD,P=0.5mm,卧贴; JLCPCB Part Class: Extended Part; Datasheet: https://item.szlcsc.com/datasheet/05B20L06P/24065925.html; Supplier: LCSC; Locking Feature: 抽屉式; Contact Type: 下接; Number of Contacts: 6P; Pitch: 0.5mm; Height Above Board: 2mm; Contact Plating: 锡
L2 = SWPA4030S2R2NT: 电感值:2.2uH;精度:±30%;额定电流:2.95A;饱和电流(Isat):5.8A;类型:-;; LCSC Part Name: 2.2uH ±30% 5.8A; Supplier Part: C279948; Manufacturer: Sunlord(顺络); Supplier Footprint: SMD,4x4mm; JLCPCB Part Class: Extended Part; Datasheet: https://item.szlcsc.com/datasheet/SWPA4030S2R2NT/266524.html; Supplier: LCSC; Tolerance: ±30%; Current Rating: 2.95A; Current - Saturation(Isat): 5.8A; DC Resistance(DCR): 30mΩ
L3 = WPN4020H2R2MT: 电感值:2.2uH;精度:±20%;额定电流:4.3A;饱和电流(Isat):7.6A;类型:-;; LCSC Part Name: 2.2uH ±20% 7.6A; Supplier Part: C98361; Manufacturer: Sunlord(顺络); Supplier Footprint: SMD,4x4mm; JLCPCB Part Class: Extended Part; Datasheet: https://item.szlcsc.com/datasheet/WPN4020H2R2MT/99570.html; Supplier: LCSC; Tolerance: ±20%; Current Rating: 4.3A; Current - Saturation(Isat): 7.6A; DC Resistance(DCR): 48mΩ
Q1 = NTR4503NT1G_C19829404: 漏源电压(Vdss):30V;连续漏极电流(Id):3A;导通电阻(RDS(on)):95mΩ@4.5V;耗散功率(Pd):900mW;阈值电压(Vgs(th)):3V@250uA;; LCSC Part Name: 耐压:30V 电流:3A; Supplier Part: C19829404; Manufacturer: TECH PUBLIC(台舟); Supplier Footprint: SOT-23; JLCPCB Part Class: Extended Part; Datasheet: https://item.szlcsc.com/datasheet/NTR4503NT1G/21156699.html; Supplier: LCSC; Drain to Source Voltage: 30V; Current - Continuous Drain(Id): 3A; RDS(on): 95mΩ@4.5V; Pd - Power Dissipation: 900mW; Gate Threshold Voltage (Vgs(th)): 3V@250uA; Gate Charge(Qg): 10nC@10V; Input Capacitance(Ciss): 235pF; Reverse Transfer Capacitance (Crss@Vds): 18pF; Operating Temperature: -55℃~+150℃; Output Capacitance(Coss): 35pF
Q2 = AO3401A: 漏源电压(Vdss):30V;连续漏极电流(Id):4.2A;导通电阻(RDS(on)):55mΩ@10V,4.2A;耗散功率(Pd):1.2W;阈值电压(Vgs(th)):-;; LCSC Part Name: 耐压:30V 电流:4.2A; Supplier Part: C5122001; Manufacturer: TECH PUBLIC(台舟); Supplier Footprint: SOT-23; JLCPCB Part Class: Extended Part; Datasheet: https://item.szlcsc.com/datasheet/AO3401A/5710587.html; Supplier: LCSC; Drain to Source Voltage: 30V; Current - Continuous Drain(Id): 4.2A; RDS(on): 55mΩ@10V,4.2A; Pd - Power Dissipation: 1.2W; Gate Charge(Qg): 8.5nC; Input Capacitance(Ciss): 880pF@15V; Reverse Transfer Capacitance (Crss@Vds): 65pF@15V; Operating Temperature: -55℃~+150℃
Q3 = S8050_C916390: 晶体管类型:-;集电极电流(Ic):500mA;集射极击穿电压(Vceo):25V;耗散功率(Pd):300mW;; LCSC Part Name: 电流:500mA 电压:25V; Supplier Part: C916390; Manufacturer: JSMSEMI(杰盛微); Supplier Footprint: SOT-23; JLCPCB Part Class: Extended Part; Datasheet: https://item.szlcsc.com/datasheet/S8050/990886.html; Supplier: LCSC; Current - Collector(Ic): 500mA; Collector - Emitter Voltage VCEO: 25V; Pd - Power Dissipation: 300mW; Transition frequency(fT): 150MHz; Current - Collector Cutoff: 100nA; Vce Saturation(VCE(sat)): 600mV; Emitter-Base Voltage(Vebo): 5V; Number: 1个NPN; Configuration: 独立式
R28 R40 R42-R44 = RC0805FR-07100RL: 电阻类型:厚膜电阻;阻值:100Ω;精度:±1%;功率:125mW;工作电压:150V;温度系数:±100ppm/℃;; LCSC Part Name: 厚膜电阻 100Ω ±1% 125mW; Supplier Part: C105577; Manufacturer: YAGEO(国巨); Supplier Footprint: 0805; JLCPCB Part Class: Extended Part; Datasheet: https://item.szlcsc.com/datasheet/RC0805FR-07100RL/106792.html; Supplier: LCSC; Type: 厚膜电阻; Tolerance: ±1%; Power(Watts): 125mW; Voltage-Supply(Max): 150V; Temperature Coefficient: ±100ppm/℃; Operating Temperature: -55℃~+155℃
R30 = RC0805FR-0733RL: 电阻类型:厚膜电阻;阻值:33Ω;精度:±1%;功率:125mW;工作电压:150V;温度系数:±100ppm/℃;; LCSC Part Name: 厚膜电阻 33Ω ±1% 125mW; Supplier Part: C126353; Manufacturer: YAGEO(国巨); Supplier Footprint: 0805; JLCPCB Part Class: Extended Part; Datasheet: https://item.szlcsc.com/datasheet/RC0805FR-0733RL/137633.html; Supplier: LCSC; Type: 厚膜电阻; Tolerance: ±1%; Power(Watts): 125mW; Voltage-Supply(Max): 150V; Temperature Coefficient: ±100ppm/℃; Operating Temperature: -55℃~+155℃
R32 = RC0805FR-0736KL: 电阻类型:厚膜电阻;阻值:36kΩ;精度:±1%;功率:125mW;工作电压:150V;温度系数:±100ppm/℃;; LCSC Part Name: 厚膜电阻 36kΩ ±1% 125mW; Supplier Part: C114527; Manufacturer: YAGEO(国巨); Supplier Footprint: 0805; JLCPCB Part Class: Extended Part; Datasheet: https://item.szlcsc.com/datasheet/RC0805FR-0736KL/115771.html; Supplier: LCSC; Type: 厚膜电阻; Tolerance: ±1%; Power(Watts): 125mW; Voltage-Supply(Max): 150V; Temperature Coefficient: ±100ppm/℃; Operating Temperature: -55℃~+155℃
R33 R34 R36-R38 = RC0805JR-074K7L: 电阻类型:厚膜电阻;阻值:4.7kΩ;精度:±5%;功率:125mW;工作电压:150V;温度系数:±100ppm/℃;; LCSC Part Name: 厚膜电阻 4.7kΩ ±5% 125mW; Supplier Part: C105427; Manufacturer: YAGEO(国巨); Supplier Footprint: 0805; JLCPCB Part Class: Extended Part; Datasheet: https://item.szlcsc.com/datasheet/RC0805JR-074K7L/106642.html; Supplier: LCSC; Type: 厚膜电阻; Tolerance: ±5%; Power(Watts): 125mW; Voltage-Supply(Max): 150V; Temperature Coefficient: ±100ppm/℃; Operating Temperature: -55℃~+155℃
R35 = AC0805FR-0733KL: 电阻类型:厚膜电阻;阻值:33kΩ;精度:±1%;功率:125mW;最大工作电压:150V;温度系数:±100ppm/℃;; LCSC Part Name: 厚膜电阻 33kΩ ±1% 125mW; Supplier Part: C144563; Manufacturer: YAGEO(国巨); Supplier Footprint: 0805; JLCPCB Part Class: Extended Part; Datasheet: https://atta.szlcsc.com/upload/public/pdf/source/20180927/C229861_4ABDC471507C1ED6AFB4BA66AFC8620A.pdf; Supplier: LCSC; Type: 厚膜电阻; Tolerance: ±1%; Power(Watts): 125mW; Overload Voltage (Max): 150V; Temperature Coefficient: ±100ppm/℃; Operating Temperature Range: -55℃~+155℃
R39 = AC0805FR-0722KL: 电阻类型:厚膜电阻;阻值:22kΩ;精度:±1%;功率:125mW;工作电压:150V;温度系数:±100ppm/℃;; LCSC Part Name: 厚膜电阻 22kΩ ±1% 125mW; Supplier Part: C144574; Manufacturer: YAGEO(国巨); Supplier Footprint: 0805; JLCPCB Part Class: Extended Part; Datasheet: https://item.szlcsc.com/datasheet/AC0805FR-0722KL/155906.html; Supplier: LCSC; Type: 厚膜电阻; Tolerance: ±1%; Power(Watts): 125mW; Voltage-Supply(Max): 150V; Temperature Coefficient: ±100ppm/℃; Operating Temperature: -55℃~+155℃
R47 = RC0805FR-0710KL: 电阻类型:厚膜电阻;阻值:10kΩ;精度:±1%;功率:125mW;工作电压:150V;温度系数:±100ppm/℃;; LCSC Part Name: 厚膜电阻 10kΩ ±1% 125mW; Supplier Part: C84376; Manufacturer: YAGEO(国巨); Supplier Footprint: 0805; JLCPCB Part Class: Extended Part; Datasheet: https://item.szlcsc.com/datasheet/RC0805FR-0710KL/85546.html; Supplier: LCSC; Type: 厚膜电阻; Tolerance: ±1%; Power(Watts): 125mW; Voltage-Supply(Max): 150V; Temperature Coefficient: ±100ppm/℃; Operating Temperature: -55℃~+155℃
R48 = RC0805FR-0715KL: 电阻类型:厚膜电阻;阻值:15kΩ;精度:±1%;功率:125mW;工作电压:150V;温度系数:±100ppm/℃;; LCSC Part Name: 厚膜电阻 15kΩ ±1% 125mW; Supplier Part: C114559; Manufacturer: YAGEO(国巨); Supplier Footprint: 0805; JLCPCB Part Class: Extended Part; Datasheet: https://item.szlcsc.com/datasheet/RC0805FR-0715KL/115803.html; Supplier: LCSC; Type: 厚膜电阻; Tolerance: ±1%; Power(Watts): 125mW; Voltage-Supply(Max): 150V; Temperature Coefficient: ±100ppm/℃; Operating Temperature: -55℃~+155℃
R53 = SDNT1608X103F3950FTF: 阻值:10kΩ;B值(25℃/50℃):3950K;电阻精度:±1%;功率:100mW;B值精度:±1%;最大稳态电流(25℃):330uA;; LCSC Part Name: 10kΩ 3950K 100mW 片式NTC热敏电阻器; Supplier Part: C279936; Manufacturer: Sunlord(顺络); Supplier Footprint: 0603; JLCPCB Part Class: Extended Part; Datasheet: https://item.szlcsc.com/datasheet/SDNT1608X103F3950FTF/266512.html; Supplier: LCSC; Resistance @ 25℃: 10kΩ; B Constant (25℃/50℃): 3950K; Resistance Tolerance: ±1%; Power(Watts): 100mW; B Constant Tolerance: ±1%; Steady State Current (Max): 330uA; Operating Temperature: -55℃~+125℃; Dissipation Factor: 1mW/℃; Thermal Time Constant: 5s; Length: 1.6mm; Width: 0.8mm; Height: 0.8mm
SW2 = SK-12D02-G030: 电路结构:单刀双掷;安装方式:弯插;开关颜色:黑色;额定电流:1A;额定电压:24V;工作寿命:1万次;; LCSC Part Name: 拨动开关SK-12D02 柄高3mm; Supplier Part: C5446808; Manufacturer: G-Switch(品赞); Supplier Footprint: 弯插,8.6x4.7mm; JLCPCB Part Class: Extended Part; Datasheet: https://item.szlcsc.com/datasheet/SK-12D02-G030/6342982.html; Supplier: LCSC; Circuit: 单刀双掷; Actuator Style: 矩形柱状; Termination Style: PC引脚; Length: 8.6mm; Width: 4.7mm; Switch Height: 7.5mm; Mounting Type: 弯插; Actuator Color: 黑色; Current Rating: 1A; Voltage Rating: 24V; Life: 1万次; Operating Temperature: -25℃~+70℃
U11 = HC-FPC-0.5-10P-CSH20: 锁定特性:抽屉式;触点类型:上接;触点数量:10P;间距:0.5mm;安装方式:卧贴;工作温度:-25℃~+85℃;; LCSC Part Name: 间距:0.5mm P数:10P 抽屉式 上接; Supplier Part: C19273947; Manufacturer: HC(虹成电子); Supplier Footprint: SMD,P=0.5mm,卧贴; JLCPCB Part Class: Extended Part; Datasheet: https://item.szlcsc.com/datasheet/HC-FPC-0.5-10P-CSH20/20558497.html; Supplier: LCSC; Locking Feature: 抽屉式; Contact Type: 上接; Number of Contacts: 10P; Pitch: 0.5mm; Mounting Type: 卧贴; FFC, FCB Thickness: 0.3mm; Height Above Board: 2mm; Contact Material: 铜; Contact Plating: 锡; Operating Temperature: -25℃~+85℃
U12 = ETA1039S2G: 功能类型:升压型;工作电压:-;输出电压:5V;输出电流:1.5A;输出类型:固定;; LCSC Part Name: 升压型 1.5A; Supplier Part: C42383374; Manufacturer: ETA(钰泰); Supplier Footprint: SOT-23-6; JLCPCB Part Class: Extended Part; Datasheet: https://item.szlcsc.com/datasheet/ETA1039S2G/44301760.html; Supplier: LCSC; Function: 升压型; Output Voltage: 5V; Output Current: 1.5A; Frequency - Switching: 700kHz~1.3MHz; Operating Temperature: -40℃~+85℃; Synchronous Rectifier: 是; Number of Outputs: 1; Topology: 升压式; Quiescent Current: 40uA; Switch tube (built-in/external): 内置; Output Type: 固定; Features: 轻载高效模式；可调限流；负载断开；打嗝限流
U13 U14 = 2541WV-05P: 插针结构:1x5P;间距:2.54mm;圆针/方针:方针;安装方式:直插;排数:单排;总PIN位数:5P;配合针长度:6mm;塑高:2.54mm;端接针长度:3mm;触头镀层:金;工作温度:-55℃~+105℃;; LCSC Part Name: 1x5P 间距:2.54mm 方针 直插; Supplier Part: C5383114; Manufacturer: HanElectricity(瀚源); Supplier Footprint: 插件,P=2.54mm; JLCPCB Part Class: 扩展库; Datasheet: https://item.szlcsc.com/datasheet/2541WV-05P/6258474.html; Supplier: LCSC; Pin Structure: 1x5P; Pitch: 2.54mm; Circluar Pins/Square Pins: 方针; Mounting Type: 直插; Number of Rows: 单排; Number of Pins: 5P; Length of Mating Pin: 6mm; Insulation Height: 2.54mm; Length of End Connection Pin: 3mm; Contact Plating: 金; Operating Temperature: -55℃~+105℃
U15 = HYG-8503A-5027: 频率:2.731kHz;声压(SPL):85dB;; LCSC Part Name: 贴片无源蜂鸣器HYG-8503A-5027 5V; Supplier Part: C18623826; Manufacturer: HYDZ(华宇); Supplier Footprint: SMD; JLCPCB Part Class: Extended Part; Datasheet: https://item.szlcsc.com/datasheet/HYG-8503A-5027/19815519.html; Supplier: LCSC; Current Consumption: 90mA; Sound Pressure Level(SPL): 85dB
U16 = SGM41524YTDC8G/TR: 工作电压:3.5V~5.5V;最大充电电流:2.3A;电池类型:锂电池;电池节数:1;; LCSC Part Name: 紧凑型开关式锂/聚合物电池充电器; Supplier Part: C699852; Manufacturer: SGMICRO(圣邦微); Supplier Footprint: DFN-8-EP(2x3); JLCPCB Part Class: Extended Part; Datasheet: https://item.szlcsc.com/datasheet/SGM41524YTDC8G%252FTR/734526.html; Supplier: LCSC; The Chip Type: 充电芯片; Voltage - Supply: 3.5V~5.5V; Charge Current - Max: 2.3A; Charging Saturation Voltage: 4.2V; Type of Battery: 锂电池; Number of Cells: 1; Operating Temperature: -40℃~+85℃; Battery Temperature Detection: 支持; Supply Current (Iq): 15uA; Features: 恒压充电；恒流充电；自动再充电；充电终止；可编程充电电流；过压保护；涓流充电
U19-U21 = 电池焊盘

## Nets
+3.3V: C5.2 C7.2 C8.2 C13.2 C14.2 C15.2 FPC1.1 Q2.2(S) R2.2 R5.2 R11.2 R17.2 R25.2 R33.2 R34.2 R36.2 R37.2 R38.2 U6.3(VCCA) U8.2(3V3) U9.6 U10.3(OUT) U11.8
+5V: C1.2 C2.2 C3.2 C4.1 C6.2 C11.2 C12.2 C22.2 R10.1 R12.2 TVS1.1(K) U1.5(VCC) U2.5(VCC) U4.8(VCC) U5.5(VCC) U6.7(VCCB) U10.2(IN(TAB)) U15.1(+) U22.2(VOUT) U22.7(VOUT)
GND: C1.1 C2.1 C3.1 C4.2 C5.1 C6.1 C7.1 C8.1 C9.1 C10.1 C11.1 C12.1 C13.1 C14.1 C15.1 C16.1 C17.2 C18.2 C20.2 C21.2 C22.1 C23.2 C24.1 C25.1 C26.1 C27.1 C28.2 C29.1 C30.1 CN1.1 CN2.1 CN3.1 CN3.4 CN3.5 D1.3 D3.2 D4.2(A) FPC1.6 FPC1.7 FPC1.8 LED1.2(K) LED2.2(-) LED3.2(-) Q1.2(S) R3.2 R4.2 R13.2 R19.1 R20.1 R21.1 R24.1 R26.2 R32.1 R35.2 R44.1 R45.2 R47.2 R49.1 R52.2 R53.1 SW1.2 SW2.4 SW2.5 TVS1.2(A) U1.1(OE#) U1.3(GND) U2.3(GND) U3.1(K) U4.5(GND) U5.3(GND) U6.2(GND) U7.1(K) U8.1(GND) U8.40(GND) U8.41(GND) U9.5 U10.1(GND) U11.1 U11.10 U11.11 U11.12 U12.2(GND) U13.1 U13.2 U13.3 U13.4 U13.5 U14.1 U16.8(GND) U16.9(GND) U17.1(SHELL) U17.2(SHELL) U17.3(SHELL) U17.4(SHELL) U17.A1B12(GND) U17.B1A12(GND) U19.1 U22.1(GND) U22.4(ON#) U22.5(GND)
VBAT: C28.1 CN3.3 L3.1 R18.2 SW2.3 U16.5(VBAT) U20.1
VBUS: D3.5 F1.2 R46.2 U17.A4B9(VBUS) U17.B4A9(VBUS)
A: R37.1 R40.2 U14.4
B: R36.1 R43.2 U14.5
BAT_ADC: C10.2 R18.1 R21.2 U8.39(IO1)
BEEP: R41.1 U8.21(IO13)
CHARGING: R35.1 R39.2 U8.35(IO42)
CTP_INT: FPC1.4 U8.8(IO15)
CTP_RST: FPC1.5 U8.7(IO7)
CTP_SCL: FPC1.3 R34.1 U8.9(IO16)
CTP_SDA: FPC1.2 R33.1 U8.10(IO17)
DMX_EN: U1.2(A) U8.25(IO48)
DMX_OE: R2.1 U6.6(OE) U8.24(IO47)
DMX_RX: U6.4(A2) U8.22(IO14)
DMX_TX: U6.5(A1) U8.23(IO21)
DN: R50.1 U17.A7(DN1) U17.B7(DN2)
DP: R51.2 U17.A6(DP1) U17.B6(DP2)
EN: C9.2 R11.1 SW1.1 U8.3(EN) U9.2
ENCODER_A: C26.2 R40.1 U8.5(IO5)
ENCODER_B: C25.2 R43.1 U8.4(IO4)
ENCODER_KEY: C27.2 R42.2 U8.6(IO6)
IO0: R17.1 U8.27(IO0) U9.1
KEY: R38.1 R42.1 U14.3
LCD_A: R30.1 U11.9
LCD_BL: R28.1 U8.20(IO12)
LCD_CS: U8.17(IO9) U11.5
LCD_RS: U8.11(IO18) U11.7
LCD_RST: U8.12(IO8) U11.6
LCD_SCL: U8.18(IO10) U11.4
LCD_SDA: U8.19(IO11) U11.2
LED2: R22.2 R49.2 U8.15(IO3)
LED3: R23.2 U8.31(IO38)
RXD0: U8.36(RXD0) U9.3
RZ_CLK: U5.2(A) U8.32(IO39)
RZ_DATA: U2.2(A) U8.33(IO40)
RZ_OE: R5.1 U2.1(OE#) U5.1(OE#) U8.38(IO2)
TXD0: U8.37(TXD0) U9.4
USB_DET: C29.2 R24.2 R46.1 U8.34(IO41)
USB_DN: D3.1 D3.6 R50.2 U8.13(IO19)
USB_DP: D3.3 D3.4 R51.1 U8.14(IO20)
VCHAR: C23.1 C24.2 D4.1(K) F1.1 R27.1 R48.1 R54.2 TVC.1 U16.7(VIN) U22.3(VIN1)
VDC_5V: C20.1 C21.1 TVDC.1 U12.1(OUT) U22.6(VIN2)
$1N61: CN1.3 L1.3 R7.1 R10.2 TA.1 U7.2(A)
$1N69: R3.1 U1.4(Y) U4.2(RE#) U4.3(DE)
$1N71: CN1.2 L1.4 R4.1 R7.2 TB.1 U3.2(A)
$1N81: R1.2 U2.4(Y)
$1N82: R8.2 U5.4(Y)
$1N83: CN2.2 D1.2 R1.1 TDATA.1
$1N88: U4.1(R) U6.1(B2)
$1N92: U4.4(D) U6.8(B1)
$1N94: CN2.3 D1.1 R8.1 TCLK.1
$1N98: R6.2 U4.7(B)
$1N99: R9.2 U4.6(A)
$1N105: LED1.1(A) R12.1
$1N108: L1.1 R6.1
$1N109: L1.2 R9.1
$1N111: LED2.1(+) R22.1
$1N113: LED3.1(+) R23.1
$1N120: R20.2 U8.26(IO45)
$1N121: R19.2 U8.16(IO46)
$1N139: R52.1 U17.B5(CC2)
$1N140: R13.1 U17.A5(CC1)
$1N151: R54.1 U22.8(ST)
$2N5: Q3.3(C) U15.2
$2N7: Q3.2(E) R44.2
$2N9: Q3.1(B) R41.2
$2N53: Q2.3(D) R30.2
$2N57: Q2.1(G) R25.1 R28.2
$2N64: R31.1 R32.2 U12.5(ISET)
$2N65: L2.1 U12.6(SW)
$2N66: C16.2 Q1.3(D) R29.2 U12.3(EN)
$2N70: C17.1 C18.1 L2.2 R29.1 R31.2 SW2.2 U12.4(IN)
$2N73: R47.1 U16.4(CC)
$2N76: R45.1 U16.3(CV)
$2N77: L3.2 U16.1(SW)
$2N79: C30.2 CN3.2 R48.2 R53.2 U16.6(NTC) U21.1
$2N87: Q1.1(G) R26.1 R27.2
$2N101: R39.1 U16.2(IND)

Not connected (* = marked no-connect by the designer): SW1 3 4; SW2 1; U8 28(IO35)* 29(IO36)* 30(IO37)*; U11 3; U14 2; U15 3 4; U17 A8(SBU1) B8(SBU2)

## Notes on the sheets
sheet 1
- M4 RS485模块
- M5 归零码模块
- MCU模块
- M1 USB模块
- M2 电源模块
sheet 2
- DC DC 模块
- 2.0 Display
- 蜂鸣器
- 旋转编码器
- 充电 模块
